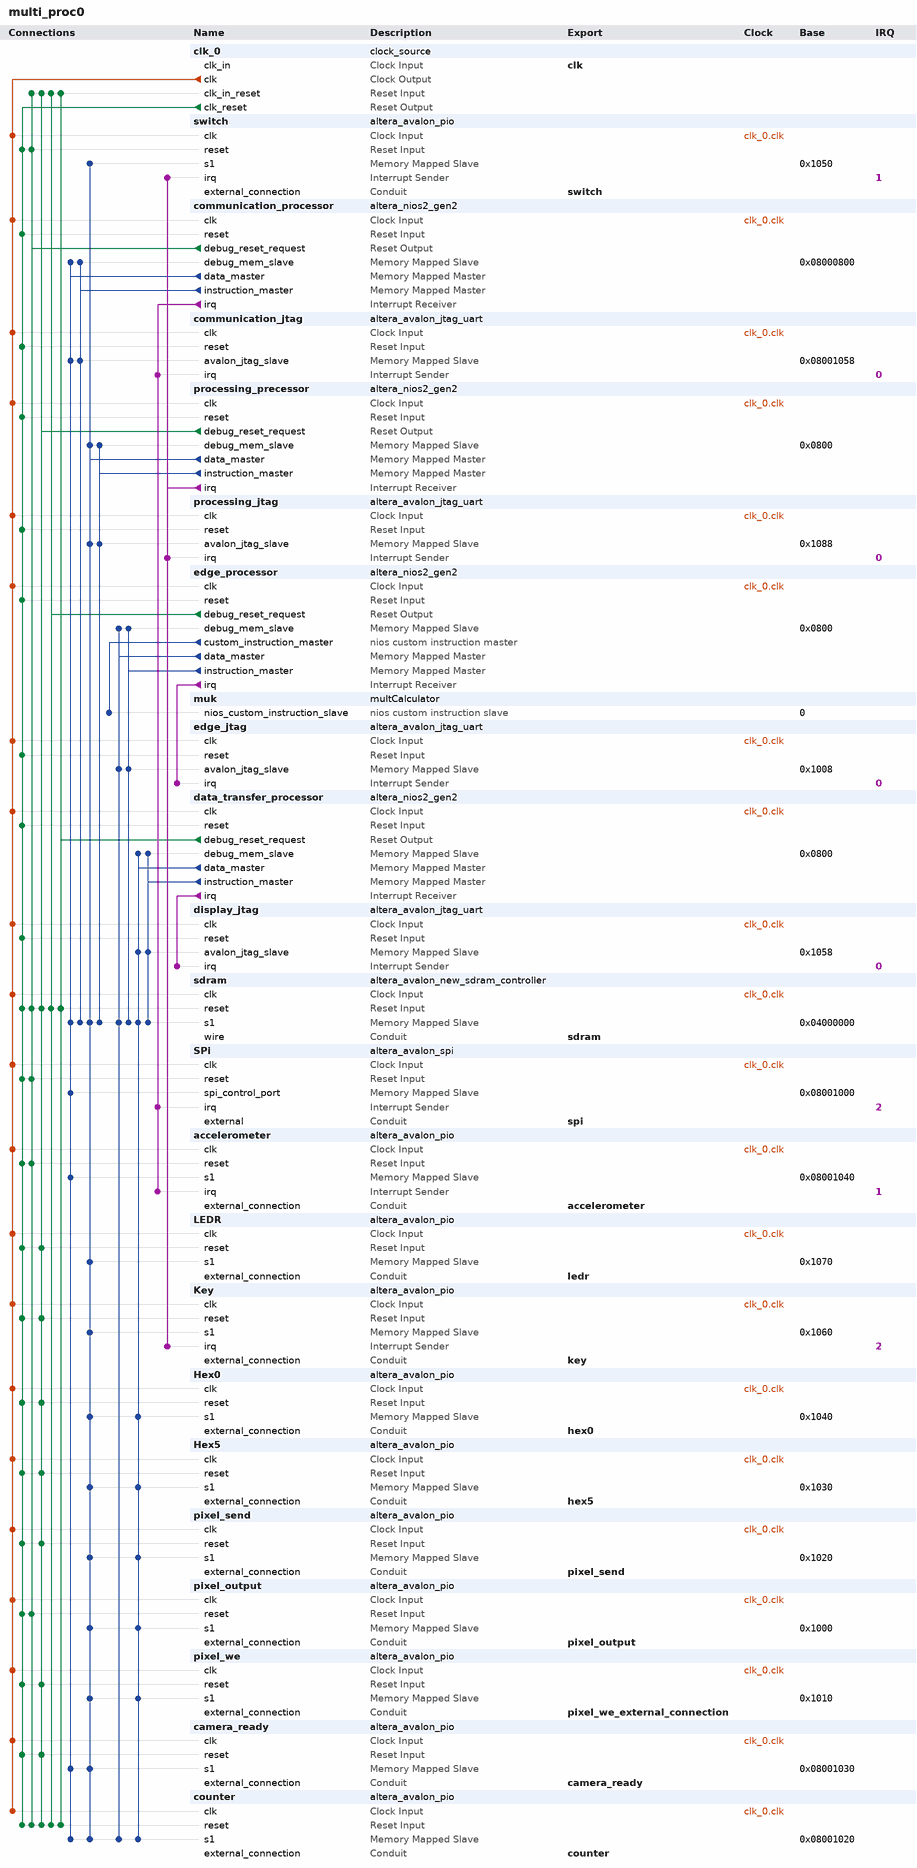
[diagram p0: system contents]
# Platform Designer (Qsys) system multi_proc0, MAX 10 10M50DAF484C7G
# Parameters at their usual value, and those the tool derives, are not listed.
package require -exact qsys 18.1
create_system multi_proc0
set_project_property DEVICE_FAMILY {MAX 10}
set_project_property DEVICE 10M50DAF484C7G

add_instance clk_0 clock_source 18.1
set_instance_parameter_value clk_0 clockFrequency 50000000

add_instance switch altera_avalon_pio 18.1
set_instance_parameter_value switch direction Input
set_instance_parameter_value switch generateIRQ true
set_instance_parameter_value switch width 10

add_instance communication_processor altera_nios2_gen2 18.1
set_instance_parameter_value communication_processor dcache_size 2048
set_instance_parameter_value communication_processor exceptionSlave sdram.s1
set_instance_parameter_value communication_processor icache_size 4096
set_instance_parameter_value communication_processor impl Fast
set_instance_parameter_value communication_processor resetSlave sdram.s1

add_instance communication_jtag altera_avalon_jtag_uart 18.1
set_instance_parameter_value communication_jtag simInteractiveOptions NO_INTERACTIVE_WINDOWS

add_instance processing_precessor altera_nios2_gen2 18.1
set_instance_parameter_value processing_precessor cpuID 1
set_instance_parameter_value processing_precessor dcache_size 2048
set_instance_parameter_value processing_precessor exceptionOffset 1048608
set_instance_parameter_value processing_precessor exceptionSlave sdram.s1
set_instance_parameter_value processing_precessor icache_size 4096
set_instance_parameter_value processing_precessor impl Fast
set_instance_parameter_value processing_precessor resetOffset 1048576
set_instance_parameter_value processing_precessor resetSlave sdram.s1

add_instance processing_jtag altera_avalon_jtag_uart 18.1
set_instance_parameter_value processing_jtag simInteractiveOptions NO_INTERACTIVE_WINDOWS

add_instance edge_processor altera_nios2_gen2 18.1
set_instance_parameter_value edge_processor cpuID 3
set_instance_parameter_value edge_processor dcache_size 2048
set_instance_parameter_value edge_processor exceptionOffset 3145760
set_instance_parameter_value edge_processor exceptionSlave sdram.s1
set_instance_parameter_value edge_processor icache_size 4096
set_instance_parameter_value edge_processor impl Fast
set_instance_parameter_value edge_processor resetOffset 3145728
set_instance_parameter_value edge_processor resetSlave sdram.s1

add_instance muk multCalculator 1.0

add_instance edge_jtag altera_avalon_jtag_uart 18.1
set_instance_parameter_value edge_jtag simInteractiveOptions NO_INTERACTIVE_WINDOWS

add_instance data_transfer_processor altera_nios2_gen2 18.1
set_instance_parameter_value data_transfer_processor cpuID 2
set_instance_parameter_value data_transfer_processor dcache_size 2048
set_instance_parameter_value data_transfer_processor exceptionOffset 2097184
set_instance_parameter_value data_transfer_processor exceptionSlave sdram.s1
set_instance_parameter_value data_transfer_processor icache_size 4096
set_instance_parameter_value data_transfer_processor impl Fast
set_instance_parameter_value data_transfer_processor resetOffset 2097152
set_instance_parameter_value data_transfer_processor resetSlave sdram.s1

add_instance display_jtag altera_avalon_jtag_uart 18.1
set_instance_parameter_value display_jtag simInteractiveOptions NO_INTERACTIVE_WINDOWS

add_instance sdram altera_avalon_new_sdram_controller 18.1
set_instance_parameter_value sdram TAC 5.5
set_instance_parameter_value sdram TRCD 20.0
set_instance_parameter_value sdram TRP 20.0
set_instance_parameter_value sdram casLatency 3
set_instance_parameter_value sdram columnWidth 10
set_instance_parameter_value sdram dataWidth 16
set_instance_parameter_value sdram generateSimulationModel false
set_instance_parameter_value sdram model single_Micron_MT48LC4M32B2_7_chip
set_instance_parameter_value sdram numberOfBanks 4
set_instance_parameter_value sdram numberOfChipSelects 1
set_instance_parameter_value sdram powerUpDelay 100.0
set_instance_parameter_value sdram refreshPeriod 15.625
set_instance_parameter_value sdram rowWidth 13

add_instance SPi altera_avalon_spi 18.1
set_instance_parameter_value SPi clockPhase 1
set_instance_parameter_value SPi clockPolarity 1
set_instance_parameter_value SPi dataWidth 8
set_instance_parameter_value SPi masterSPI true
set_instance_parameter_value SPi numberOfSlaves 2
set_instance_parameter_value SPi targetClockRate 5000000

add_instance accelerometer altera_avalon_pio 18.1
set_instance_parameter_value accelerometer captureEdge true
set_instance_parameter_value accelerometer direction Input
set_instance_parameter_value accelerometer generateIRQ true
set_instance_parameter_value accelerometer irqType EDGE
set_instance_parameter_value accelerometer width 1

add_instance LEDR altera_avalon_pio 18.1
set_instance_parameter_value LEDR direction Output
set_instance_parameter_value LEDR width 10

add_instance Key altera_avalon_pio 18.1
set_instance_parameter_value Key direction Input
set_instance_parameter_value Key generateIRQ true
set_instance_parameter_value Key width 2

add_instance Hex0 altera_avalon_pio 18.1
set_instance_parameter_value Hex0 direction Output
set_instance_parameter_value Hex0 width 24

add_instance Hex5 altera_avalon_pio 18.1
set_instance_parameter_value Hex5 direction Output
set_instance_parameter_value Hex5 width 24

add_instance pixel_send altera_avalon_pio 18.1
set_instance_parameter_value pixel_send direction Output
set_instance_parameter_value pixel_send width 17

add_instance pixel_output altera_avalon_pio 18.1
set_instance_parameter_value pixel_output direction Output
set_instance_parameter_value pixel_output width 4

add_instance pixel_we altera_avalon_pio 18.1
set_instance_parameter_value pixel_we direction Output
set_instance_parameter_value pixel_we width 1

add_instance camera_ready altera_avalon_pio 18.1
set_instance_parameter_value camera_ready direction Input
set_instance_parameter_value camera_ready width 1

add_instance counter altera_avalon_pio 18.1
set_instance_parameter_value counter direction Input
set_instance_parameter_value counter width 32

# connections
add_connection clk_0.clk accelerometer.clk clock
add_connection clk_0.clk camera_ready.clk clock
add_connection clk_0.clk communication_jtag.clk clock
add_connection clk_0.clk communication_processor.clk clock
add_connection clk_0.clk counter.clk clock
add_connection clk_0.clk data_transfer_processor.clk clock
add_connection clk_0.clk display_jtag.clk clock
add_connection clk_0.clk edge_jtag.clk clock
add_connection clk_0.clk edge_processor.clk clock
add_connection clk_0.clk Hex0.clk clock
add_connection clk_0.clk Hex5.clk clock
add_connection clk_0.clk Key.clk clock
add_connection clk_0.clk LEDR.clk clock
add_connection clk_0.clk pixel_output.clk clock
add_connection clk_0.clk pixel_send.clk clock
add_connection clk_0.clk pixel_we.clk clock
add_connection clk_0.clk processing_jtag.clk clock
add_connection clk_0.clk processing_precessor.clk clock
add_connection clk_0.clk sdram.clk clock
add_connection clk_0.clk SPi.clk clock
add_connection clk_0.clk switch.clk clock
add_connection clk_0.clk_reset accelerometer.reset reset
add_connection clk_0.clk_reset camera_ready.reset reset
add_connection clk_0.clk_reset communication_jtag.reset reset
add_connection clk_0.clk_reset communication_processor.reset reset
add_connection clk_0.clk_reset counter.reset reset
add_connection clk_0.clk_reset data_transfer_processor.reset reset
add_connection clk_0.clk_reset display_jtag.reset reset
add_connection clk_0.clk_reset edge_jtag.reset reset
add_connection clk_0.clk_reset edge_processor.reset reset
add_connection clk_0.clk_reset Hex0.reset reset
add_connection clk_0.clk_reset Hex5.reset reset
add_connection clk_0.clk_reset Key.reset reset
add_connection clk_0.clk_reset LEDR.reset reset
add_connection clk_0.clk_reset pixel_output.reset reset
add_connection clk_0.clk_reset pixel_send.reset reset
add_connection clk_0.clk_reset pixel_we.reset reset
add_connection clk_0.clk_reset processing_jtag.reset reset
add_connection clk_0.clk_reset processing_precessor.reset reset
add_connection clk_0.clk_reset sdram.reset reset
add_connection clk_0.clk_reset SPi.reset reset
add_connection clk_0.clk_reset switch.reset reset
add_connection communication_processor.debug_reset_request accelerometer.reset reset
add_connection communication_processor.debug_reset_request clk_0.clk_in_reset reset
add_connection communication_processor.debug_reset_request counter.reset reset
add_connection communication_processor.debug_reset_request pixel_output.reset reset
add_connection communication_processor.debug_reset_request sdram.reset reset
add_connection communication_processor.debug_reset_request SPi.reset reset
add_connection communication_processor.debug_reset_request switch.reset reset
add_connection data_transfer_processor.debug_reset_request clk_0.clk_in_reset reset
add_connection data_transfer_processor.debug_reset_request counter.reset reset
add_connection data_transfer_processor.debug_reset_request sdram.reset reset
add_connection edge_processor.debug_reset_request clk_0.clk_in_reset reset
add_connection edge_processor.debug_reset_request counter.reset reset
add_connection edge_processor.debug_reset_request sdram.reset reset
add_connection processing_precessor.debug_reset_request camera_ready.reset reset
add_connection processing_precessor.debug_reset_request clk_0.clk_in_reset reset
add_connection processing_precessor.debug_reset_request counter.reset reset
add_connection processing_precessor.debug_reset_request Hex0.reset reset
add_connection processing_precessor.debug_reset_request Hex5.reset reset
add_connection processing_precessor.debug_reset_request Key.reset reset
add_connection processing_precessor.debug_reset_request LEDR.reset reset
add_connection processing_precessor.debug_reset_request pixel_send.reset reset
add_connection processing_precessor.debug_reset_request pixel_we.reset reset
add_connection processing_precessor.debug_reset_request sdram.reset reset
add_connection communication_processor.data_master accelerometer.s1 avalon
set_connection_parameter_value communication_processor.data_master/accelerometer.s1 baseAddress 0x08001040
add_connection communication_processor.data_master camera_ready.s1 avalon
set_connection_parameter_value communication_processor.data_master/camera_ready.s1 baseAddress 0x08001030
add_connection communication_processor.data_master communication_jtag.avalon_jtag_slave avalon
set_connection_parameter_value communication_processor.data_master/communication_jtag.avalon_jtag_slave baseAddress 0x08001058
add_connection communication_processor.data_master communication_processor.debug_mem_slave avalon
set_connection_parameter_value communication_processor.data_master/communication_processor.debug_mem_slave baseAddress 0x08000800
add_connection communication_processor.data_master counter.s1 avalon
set_connection_parameter_value communication_processor.data_master/counter.s1 baseAddress 0x08001020
add_connection communication_processor.data_master sdram.s1 avalon
set_connection_parameter_value communication_processor.data_master/sdram.s1 baseAddress 0x04000000
add_connection communication_processor.data_master SPi.spi_control_port avalon
set_connection_parameter_value communication_processor.data_master/SPi.spi_control_port baseAddress 0x08001000
add_connection communication_processor.instruction_master communication_jtag.avalon_jtag_slave avalon
set_connection_parameter_value communication_processor.instruction_master/communication_jtag.avalon_jtag_slave baseAddress 0x08001058
add_connection communication_processor.instruction_master communication_processor.debug_mem_slave avalon
set_connection_parameter_value communication_processor.instruction_master/communication_processor.debug_mem_slave baseAddress 0x08000800
add_connection communication_processor.instruction_master sdram.s1 avalon
set_connection_parameter_value communication_processor.instruction_master/sdram.s1 baseAddress 0x04000000
add_connection data_transfer_processor.data_master counter.s1 avalon
set_connection_parameter_value data_transfer_processor.data_master/counter.s1 baseAddress 0x08001020
add_connection data_transfer_processor.data_master data_transfer_processor.debug_mem_slave avalon
set_connection_parameter_value data_transfer_processor.data_master/data_transfer_processor.debug_mem_slave baseAddress 0x0800
add_connection data_transfer_processor.data_master display_jtag.avalon_jtag_slave avalon
set_connection_parameter_value data_transfer_processor.data_master/display_jtag.avalon_jtag_slave baseAddress 0x1058
add_connection data_transfer_processor.data_master Hex0.s1 avalon
set_connection_parameter_value data_transfer_processor.data_master/Hex0.s1 baseAddress 0x1040
add_connection data_transfer_processor.data_master Hex5.s1 avalon
set_connection_parameter_value data_transfer_processor.data_master/Hex5.s1 baseAddress 0x1030
add_connection data_transfer_processor.data_master pixel_output.s1 avalon
set_connection_parameter_value data_transfer_processor.data_master/pixel_output.s1 baseAddress 0x1000
add_connection data_transfer_processor.data_master pixel_send.s1 avalon
set_connection_parameter_value data_transfer_processor.data_master/pixel_send.s1 baseAddress 0x1020
add_connection data_transfer_processor.data_master pixel_we.s1 avalon
set_connection_parameter_value data_transfer_processor.data_master/pixel_we.s1 baseAddress 0x1010
add_connection data_transfer_processor.data_master sdram.s1 avalon
set_connection_parameter_value data_transfer_processor.data_master/sdram.s1 baseAddress 0x04000000
add_connection data_transfer_processor.instruction_master data_transfer_processor.debug_mem_slave avalon
set_connection_parameter_value data_transfer_processor.instruction_master/data_transfer_processor.debug_mem_slave baseAddress 0x0800
add_connection data_transfer_processor.instruction_master display_jtag.avalon_jtag_slave avalon
set_connection_parameter_value data_transfer_processor.instruction_master/display_jtag.avalon_jtag_slave baseAddress 0x1058
add_connection data_transfer_processor.instruction_master sdram.s1 avalon
set_connection_parameter_value data_transfer_processor.instruction_master/sdram.s1 baseAddress 0x04000000
add_connection edge_processor.data_master counter.s1 avalon
set_connection_parameter_value edge_processor.data_master/counter.s1 baseAddress 0x08001020
add_connection edge_processor.data_master edge_jtag.avalon_jtag_slave avalon
set_connection_parameter_value edge_processor.data_master/edge_jtag.avalon_jtag_slave baseAddress 0x1008
add_connection edge_processor.data_master edge_processor.debug_mem_slave avalon
set_connection_parameter_value edge_processor.data_master/edge_processor.debug_mem_slave baseAddress 0x0800
add_connection edge_processor.data_master sdram.s1 avalon
set_connection_parameter_value edge_processor.data_master/sdram.s1 baseAddress 0x04000000
add_connection edge_processor.instruction_master edge_jtag.avalon_jtag_slave avalon
set_connection_parameter_value edge_processor.instruction_master/edge_jtag.avalon_jtag_slave baseAddress 0x1008
add_connection edge_processor.instruction_master edge_processor.debug_mem_slave avalon
set_connection_parameter_value edge_processor.instruction_master/edge_processor.debug_mem_slave baseAddress 0x0800
add_connection edge_processor.instruction_master sdram.s1 avalon
set_connection_parameter_value edge_processor.instruction_master/sdram.s1 baseAddress 0x04000000
add_connection processing_precessor.data_master camera_ready.s1 avalon
set_connection_parameter_value processing_precessor.data_master/camera_ready.s1 baseAddress 0x08001030
add_connection processing_precessor.data_master counter.s1 avalon
set_connection_parameter_value processing_precessor.data_master/counter.s1 baseAddress 0x08001020
add_connection processing_precessor.data_master Hex0.s1 avalon
set_connection_parameter_value processing_precessor.data_master/Hex0.s1 baseAddress 0x1040
add_connection processing_precessor.data_master Hex5.s1 avalon
set_connection_parameter_value processing_precessor.data_master/Hex5.s1 baseAddress 0x1030
add_connection processing_precessor.data_master Key.s1 avalon
set_connection_parameter_value processing_precessor.data_master/Key.s1 baseAddress 0x1060
add_connection processing_precessor.data_master LEDR.s1 avalon
set_connection_parameter_value processing_precessor.data_master/LEDR.s1 baseAddress 0x1070
add_connection processing_precessor.data_master pixel_output.s1 avalon
set_connection_parameter_value processing_precessor.data_master/pixel_output.s1 baseAddress 0x1000
add_connection processing_precessor.data_master pixel_send.s1 avalon
set_connection_parameter_value processing_precessor.data_master/pixel_send.s1 baseAddress 0x1020
add_connection processing_precessor.data_master pixel_we.s1 avalon
set_connection_parameter_value processing_precessor.data_master/pixel_we.s1 baseAddress 0x1010
add_connection processing_precessor.data_master processing_jtag.avalon_jtag_slave avalon
set_connection_parameter_value processing_precessor.data_master/processing_jtag.avalon_jtag_slave baseAddress 0x1088
add_connection processing_precessor.data_master processing_precessor.debug_mem_slave avalon
set_connection_parameter_value processing_precessor.data_master/processing_precessor.debug_mem_slave baseAddress 0x0800
add_connection processing_precessor.data_master sdram.s1 avalon
set_connection_parameter_value processing_precessor.data_master/sdram.s1 baseAddress 0x04000000
add_connection processing_precessor.data_master switch.s1 avalon
set_connection_parameter_value processing_precessor.data_master/switch.s1 baseAddress 0x1050
add_connection processing_precessor.instruction_master processing_jtag.avalon_jtag_slave avalon
set_connection_parameter_value processing_precessor.instruction_master/processing_jtag.avalon_jtag_slave baseAddress 0x1088
add_connection processing_precessor.instruction_master processing_precessor.debug_mem_slave avalon
set_connection_parameter_value processing_precessor.instruction_master/processing_precessor.debug_mem_slave baseAddress 0x0800
add_connection processing_precessor.instruction_master sdram.s1 avalon
set_connection_parameter_value processing_precessor.instruction_master/sdram.s1 baseAddress 0x04000000
add_connection communication_processor.irq accelerometer.irq interrupt
set_connection_parameter_value communication_processor.irq/accelerometer.irq irqNumber 1
add_connection communication_processor.irq communication_jtag.irq interrupt
set_connection_parameter_value communication_processor.irq/communication_jtag.irq irqNumber 0
add_connection communication_processor.irq SPi.irq interrupt
set_connection_parameter_value communication_processor.irq/SPi.irq irqNumber 2
add_connection data_transfer_processor.irq display_jtag.irq interrupt
set_connection_parameter_value data_transfer_processor.irq/display_jtag.irq irqNumber 0
add_connection edge_processor.irq edge_jtag.irq interrupt
set_connection_parameter_value edge_processor.irq/edge_jtag.irq irqNumber 0
add_connection processing_precessor.irq Key.irq interrupt
set_connection_parameter_value processing_precessor.irq/Key.irq irqNumber 2
add_connection processing_precessor.irq processing_jtag.irq interrupt
set_connection_parameter_value processing_precessor.irq/processing_jtag.irq irqNumber 0
add_connection processing_precessor.irq switch.irq interrupt
set_connection_parameter_value processing_precessor.irq/switch.irq irqNumber 1
add_connection edge_processor.custom_instruction_master muk.nios_custom_instruction_slave nios_custom_instruction
set_connection_parameter_value edge_processor.custom_instruction_master/muk.nios_custom_instruction_slave CIName multcalculator_0
set_connection_parameter_value edge_processor.custom_instruction_master/muk.nios_custom_instruction_slave baseAddress 0

# exported interfaces
add_interface accelerometer conduit end
set_interface_property accelerometer EXPORT_OF accelerometer.external_connection
add_interface camera_ready conduit end
set_interface_property camera_ready EXPORT_OF camera_ready.external_connection
add_interface clk clock sink
set_interface_property clk EXPORT_OF clk_0.clk_in
add_interface counter conduit end
set_interface_property counter EXPORT_OF counter.external_connection
add_interface hex0 conduit end
set_interface_property hex0 EXPORT_OF Hex0.external_connection
add_interface hex5 conduit end
set_interface_property hex5 EXPORT_OF Hex5.external_connection
add_interface key conduit end
set_interface_property key EXPORT_OF Key.external_connection
add_interface ledr conduit end
set_interface_property ledr EXPORT_OF LEDR.external_connection
add_interface pixel_output conduit end
set_interface_property pixel_output EXPORT_OF pixel_output.external_connection
add_interface pixel_send conduit end
set_interface_property pixel_send EXPORT_OF pixel_send.external_connection
add_interface pixel_we_external_connection conduit end
set_interface_property pixel_we_external_connection EXPORT_OF pixel_we.external_connection
add_interface sdram conduit end
set_interface_property sdram EXPORT_OF sdram.wire
add_interface spi conduit end
set_interface_property spi EXPORT_OF SPi.external
add_interface switch conduit end
set_interface_property switch EXPORT_OF switch.external_connection

set_interconnect_requirement {$system} qsys_mm.clockCrossingAdapter HANDSHAKE
set_interconnect_requirement {$system} qsys_mm.enableEccProtection FALSE
set_interconnect_requirement {$system} qsys_mm.insertDefaultSlave FALSE
set_interconnect_requirement {$system} qsys_mm.maxAdditionalLatency 1

save_system multi_proc0.qsys
